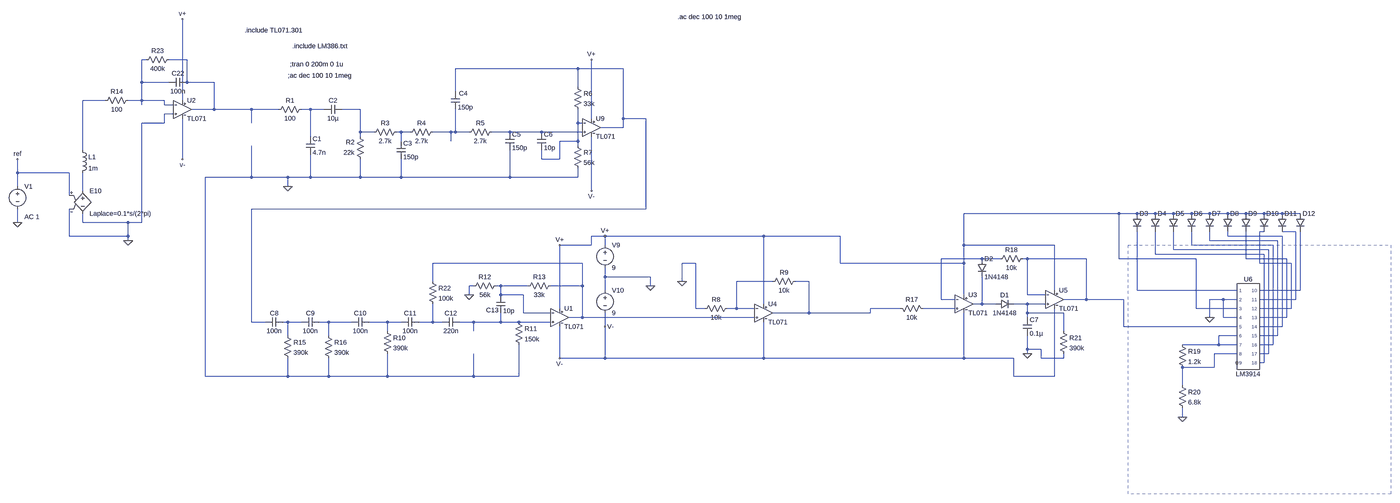
[diagram p0: schematic Analog - Final.asc, whole sheet]
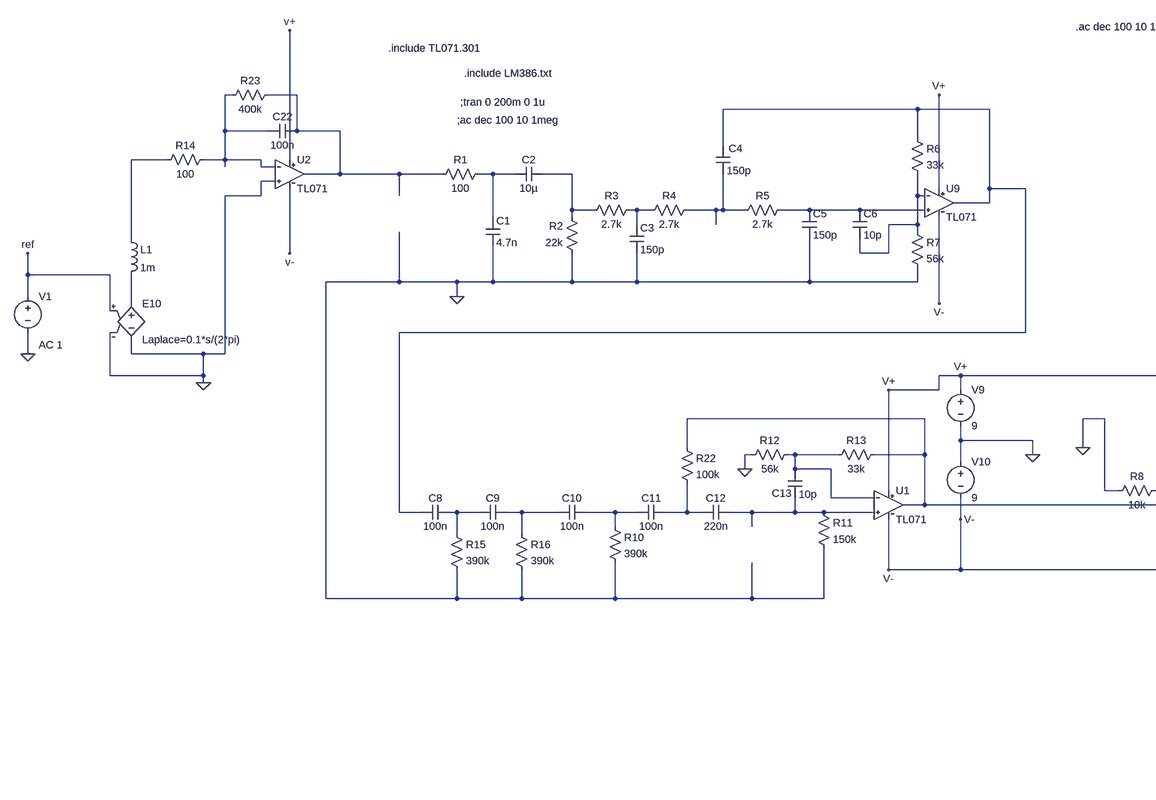
[diagram p1: schematic Analog - Final.asc, part, row 1 of 1, column 1 of 2]
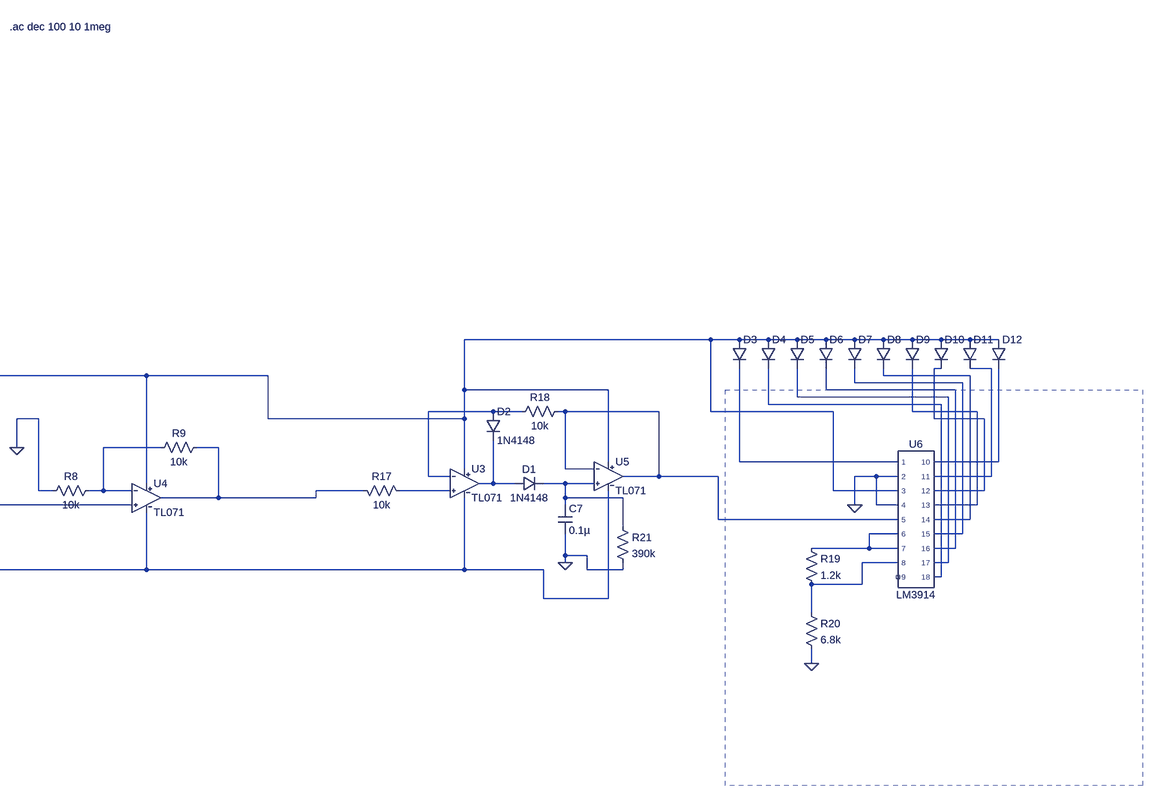
[diagram p2: schematic Analog - Final.asc, part, row 1 of 1, column 2 of 2]
Analog - Final.asc, the LTspice schematic file:
Version 4
SHEET 1 4752 1492
WIRE -560 -48 -576 -48
WIRE -416 -48 -480 -48
WIRE 992 -16 560 -16
WIRE 1152 -16 992 -16
WIRE -576 32 -576 -48
WIRE -480 32 -576 32
WIRE -416 32 -416 -48
WIRE -320 32 -416 32
WIRE 992 48 992 -16
WIRE 560 64 560 -16
WIRE -704 96 -784 96
WIRE -576 96 -576 32
WIRE -576 96 -624 96
WIRE -496 96 -576 96
WIRE -432 96 -432 -192
WIRE -576 112 -576 96
WIRE -496 112 -496 96
WIRE -464 112 -496 112
WIRE -320 128 -320 32
WIRE -320 128 -400 128
WIRE -160 128 -320 128
WIRE -64 128 -160 128
WIRE 48 128 16 128
WIRE 96 128 48 128
WIRE 224 128 160 128
WIRE -464 144 -496 144
WIRE 1040 160 1040 -48
WIRE 1152 160 1152 -16
WIRE 1232 160 1152 160
WIRE -496 176 -496 144
WIRE -496 176 -576 176
WIRE -160 176 -160 128
WIRE 992 176 992 128
WIRE 1008 176 992 176
WIRE 1152 192 1152 160
WIRE 1152 192 1072 192
WIRE 224 208 224 128
WIRE 272 208 224 208
WIRE 368 208 352 208
WIRE 400 208 368 208
WIRE 544 208 480 208
WIRE 560 208 560 128
WIRE 560 208 544 208
WIRE 608 208 560 208
WIRE 752 208 688 208
WIRE 864 208 752 208
WIRE 1008 208 864 208
WIRE 48 224 48 128
WIRE 224 224 224 208
WIRE 368 240 368 208
WIRE 544 240 544 208
WIRE 992 240 992 176
WIRE 992 240 928 240
WIRE 992 256 992 240
WIRE -784 272 -784 96
WIRE -432 304 -432 160
WIRE 864 304 864 272
WIRE 928 304 928 240
WIRE 928 304 864 304
WIRE -1056 352 -1056 304
WIRE -832 352 -1056 352
WIRE -160 368 -160 256
WIRE -160 368 -352 368
WIRE -32 368 -160 368
WIRE 48 368 48 288
WIRE 48 368 -32 368
WIRE 224 368 224 304
WIRE 224 368 48 368
WIRE 368 368 368 304
WIRE 368 368 224 368
WIRE 752 368 752 272
WIRE 752 368 368 368
WIRE 992 368 992 336
WIRE 992 368 752 368
WIRE -1056 400 -1056 352
WIRE -32 400 -32 368
WIRE -784 416 -784 352
WIRE 1040 416 1040 224
WIRE -832 432 -832 352
WIRE 1232 480 1232 160
WIRE 1232 480 -160 480
WIRE 3216 496 2640 496
WIRE 3280 496 3216 496
WIRE 3344 496 3280 496
WIRE 3408 496 3344 496
WIRE 3472 496 3408 496
WIRE 3536 496 3472 496
WIRE 3600 496 3536 496
WIRE 3664 496 3600 496
WIRE 3728 496 3664 496
WIRE 3792 496 3728 496
WIRE 3856 496 3792 496
WIRE -1056 528 -1056 480
WIRE -784 528 -784 496
WIRE -624 528 -784 528
WIRE -576 528 -576 176
WIRE -576 528 -624 528
WIRE 3728 560 3712 560
WIRE 3840 560 3792 560
WIRE -832 576 -832 480
WIRE -624 576 -624 528
WIRE -624 576 -832 576
WIRE 1088 576 1040 576
WIRE 1648 576 1088 576
WIRE 1968 576 1648 576
WIRE 3600 576 3600 560
WIRE 3792 576 3600 576
WIRE -624 592 -624 576
WIRE 3536 592 3536 560
WIRE 3776 592 3536 592
WIRE 1040 608 1040 576
WIRE 1040 608 928 608
WIRE 1088 608 1088 576
WIRE 2640 608 2640 496
WIRE 2960 608 2640 608
WIRE 3472 608 3472 560
WIRE 3760 608 3472 608
WIRE 3408 624 3408 560
WIRE 3744 624 3408 624
WIRE 3344 640 3344 560
WIRE 3728 640 3344 640
WIRE 2704 656 2560 656
WIRE 2768 656 2704 656
WIRE 2864 656 2848 656
WIRE 3072 656 2864 656
WIRE 3216 656 3216 496
WIRE 3488 656 3216 656
WIRE 3664 656 3664 560
WIRE 3808 656 3664 656
WIRE 1008 672 480 672
WIRE 1408 672 1360 672
WIRE 1968 672 1968 576
WIRE 2640 672 2640 608
WIRE 2640 672 1968 672
WIRE 3712 672 3712 560
WIRE 3824 672 3712 672
WIRE 1088 720 1088 688
WIRE 1248 720 1088 720
WIRE 480 736 480 672
WIRE 1360 736 1360 672
WIRE 1680 736 1552 736
WIRE 1808 736 1760 736
WIRE 624 752 608 752
WIRE 720 752 704 752
WIRE 816 752 720 752
WIRE 1008 752 1008 672
WIRE 1008 752 896 752
WIRE 1248 752 1248 720
WIRE 1088 768 1088 720
WIRE 2960 768 2960 608
WIRE 3280 768 3280 560
WIRE 3632 768 3280 768
WIRE 3856 768 3856 560
WIRE 3856 768 3712 768
WIRE 608 784 608 752
WIRE 720 784 720 752
WIRE 800 784 720 784
WIRE 2640 784 2640 672
WIRE 2864 784 2864 656
WIRE 2928 784 2864 784
WIRE 2560 800 2560 656
WIRE 2608 800 2560 800
WIRE 3072 800 3072 656
WIRE 3072 800 2992 800
WIRE 3232 800 3072 800
WIRE 3584 800 3536 800
WIRE 3632 800 3584 800
WIRE 3840 800 3840 560
WIRE 3840 800 3712 800
WIRE 1648 816 1648 576
WIRE 2704 816 2704 720
WIRE 2704 816 2672 816
WIRE 2752 816 2704 816
WIRE 2864 816 2816 816
WIRE 2928 816 2864 816
WIRE 928 832 928 608
WIRE 1408 832 1408 672
WIRE 1440 832 1408 832
WIRE 1552 832 1552 736
WIRE 1552 832 1520 832
WIRE 1616 832 1552 832
WIRE 2416 832 2288 832
WIRE 2608 832 2496 832
WIRE 3488 832 3488 656
WIRE 3632 832 3488 832
WIRE 3824 832 3824 672
WIRE 3824 832 3712 832
WIRE 800 848 800 784
WIRE 896 848 800 848
WIRE 1808 848 1808 736
WIRE 1808 848 1680 848
WIRE 2288 848 2288 832
WIRE 2288 848 1808 848
WIRE 2864 848 2864 816
WIRE 2992 848 2864 848
WIRE 1008 864 1008 752
WIRE 1008 864 960 864
WIRE 1616 864 1008 864
WIRE 2864 864 2864 848
WIRE 3536 864 3536 800
WIRE 3584 864 3584 800
WIRE 3632 864 3584 864
WIRE 3808 864 3808 656
WIRE 3808 864 3712 864
WIRE -160 880 -160 480
WIRE -112 880 -160 880
WIRE -32 880 -48 880
WIRE 16 880 -32 880
WIRE 112 880 80 880
WIRE 192 880 112 880
WIRE 320 880 256 880
WIRE 368 880 320 880
WIRE 480 880 480 816
WIRE 480 880 432 880
WIRE 512 880 480 880
WIRE 624 880 576 880
WIRE 720 880 720 848
WIRE 720 880 624 880
WIRE 784 880 720 880
WIRE 896 880 784 880
WIRE 1088 896 1088 848
WIRE 3232 896 3232 800
WIRE 3632 896 3232 896
WIRE 3792 896 3792 576
WIRE 3792 896 3712 896
WIRE 320 912 320 880
WIRE 624 912 624 880
WIRE 2992 912 2992 848
WIRE -32 928 -32 880
WIRE 112 928 112 880
WIRE 3632 928 3568 928
WIRE 3776 928 3776 592
WIRE 3776 928 3712 928
WIRE 3568 960 3568 928
WIRE 3568 960 3440 960
WIRE 3632 960 3568 960
WIRE 3760 960 3760 608
WIRE 3760 960 3712 960
WIRE 2864 976 2864 928
WIRE 2912 976 2864 976
WIRE 2864 992 2864 976
WIRE 3632 992 3552 992
WIRE 3744 992 3744 624
WIRE 3744 992 3712 992
WIRE 928 1008 928 896
WIRE 1088 1008 1088 896
WIRE 1088 1008 928 1008
WIRE 1648 1008 1648 880
WIRE 1648 1008 1088 1008
WIRE 2640 1008 2640 848
WIRE 2640 1008 1648 1008
WIRE 2816 1008 2640 1008
WIRE 2912 1008 2912 976
WIRE 2992 1008 2992 992
WIRE 2992 1008 2912 1008
WIRE 3728 1024 3728 640
WIRE 3728 1024 3712 1024
WIRE 3552 1040 3552 992
WIRE 3552 1040 3440 1040
WIRE -352 1072 -352 368
WIRE -32 1072 -32 1008
WIRE -32 1072 -352 1072
WIRE 112 1072 112 1008
WIRE 112 1072 -32 1072
WIRE 320 1072 320 992
WIRE 320 1072 112 1072
WIRE 624 1072 624 992
WIRE 624 1072 320 1072
WIRE 784 1072 784 960
WIRE 784 1072 624 1072
WIRE 2816 1072 2816 1008
WIRE 2960 1072 2960 832
WIRE 2960 1072 2816 1072
WIRE 3440 1104 3440 1040
WIRE 3440 1216 3440 1184
FLAG -32 400 0
FLAG 608 784 0
FLAG 1040 -48 V+
FLAG 928 608 V+
FLAG 1040 416 V-
FLAG 928 1008 V-
FLAG -624 592 0
FLAG -432 -192 v+
FLAG -432 304 v-
FLAG 1248 752 0
FLAG 1088 576 V+
FLAG 1088 896 V-
FLAG 1360 736 0
FLAG 2864 992 0
FLAG 3536 864 0
FLAG 3440 1216 0
FLAG -1056 528 0
FLAG -1056 304 ref
SYMBOL res 32 112 R90
WINDOW 0 0 56 VBottom 2
WINDOW 3 32 56 VTop 2
SYMATTR InstName R1
SYMATTR Value 100
SYMBOL res 240 320 R180
WINDOW 0 36 76 Left 2
WINDOW 3 36 40 Left 2
SYMATTR InstName R2
SYMATTR Value 22k
SYMBOL res 256 224 R270
WINDOW 0 32 56 VTop 2
WINDOW 3 0 56 VBottom 2
SYMATTR InstName R3
SYMATTR Value 2.7k
SYMBOL cap 32 224 R0
SYMATTR InstName C1
SYMATTR Value 4.7n
SYMBOL cap 160 112 R90
WINDOW 0 0 32 VBottom 2
WINDOW 3 32 32 VTop 2
SYMATTR InstName C2
SYMATTR Value 10µ
SYMBOL cap 544 64 R0
WINDOW 0 28 7 Left 2
SYMATTR InstName C4
SYMATTR Value 150p
SYMBOL res 704 192 R90
WINDOW 0 0 56 VBottom 2
WINDOW 3 32 56 VTop 2
SYMATTR InstName R5
SYMATTR Value 2.7k
SYMBOL res 976 32 R0
SYMATTR InstName R6
SYMATTR Value 33k
SYMBOL cap 736 208 R0
SYMATTR InstName C5
SYMATTR Value 150p
SYMBOL cap 848 208 R0
SYMATTR InstName C6
SYMATTR Value 10p
SYMBOL res 976 240 R0
SYMATTR InstName R7
SYMATTR Value 56k
SYMBOL res 304 896 R0
SYMATTR InstName R10
SYMATTR Value 390k
SYMBOL cap 256 864 R90
WINDOW 0 0 32 VBottom 2
WINDOW 3 32 32 VTop 2
SYMATTR InstName C10
SYMATTR Value 100n
SYMBOL cap 432 864 R90
WINDOW 0 0 32 VBottom 2
WINDOW 3 32 32 VTop 2
SYMATTR InstName C11
SYMATTR Value 100n
SYMBOL cap 576 864 R90
WINDOW 0 0 32 VBottom 2
WINDOW 3 32 32 VTop 2
SYMATTR InstName C12
SYMATTR Value 220n
SYMBOL res 464 720 R0
SYMATTR InstName R22
SYMATTR Value 100k
SYMBOL res 768 864 R0
SYMATTR InstName R11
SYMATTR Value 150k
SYMBOL cap 704 784 R0
WINDOW 0 -36 54 Left 2
SYMATTR InstName C13
SYMATTR Value 10p
SYMBOL res 720 736 R90
WINDOW 0 0 56 VBottom 2
WINDOW 3 32 56 VTop 2
SYMATTR InstName R12
SYMATTR Value 56k
SYMBOL res 912 736 R90
WINDOW 0 0 56 VBottom 2
WINDOW 3 32 56 VTop 2
SYMATTR InstName R13
SYMATTR Value 33k
SYMBOL ind -800 256 R0
SYMATTR InstName L1
SYMATTR Value 1m
SYMATTR SpiceLine Rser=1m
SYMBOL res -608 80 R90
WINDOW 0 0 56 VBottom 2
WINDOW 3 32 56 VTop 2
SYMATTR InstName R14
SYMATTR Value 100
SYMBOL res -464 -64 R90
WINDOW 0 0 56 VBottom 2
WINDOW 3 32 56 VTop 2
SYMATTR InstName R23
SYMATTR Value 400k
SYMBOL cap -416 16 R90
WINDOW 0 0 32 VBottom 2
WINDOW 3 32 32 VTop 2
SYMATTR InstName C22
SYMATTR Value 100n
SYMBOL TL071 1040 128 R0
SYMATTR InstName U9
SYMATTR SpiceModel ""
SYMBOL TL071 928 800 R0
SYMATTR InstName U1
SYMATTR SpiceModel ""
SYMBOL TL071 -432 64 R0
SYMATTR InstName U2
SYMATTR SpiceModel ""
SYMBOL voltage 1088 592 R0
WINDOW 123 0 0 Left 0
WINDOW 39 0 0 Left 0
SYMATTR InstName V9
SYMATTR Value 9
SYMBOL voltage 1088 752 R0
WINDOW 123 0 0 Left 0
WINDOW 39 0 0 Left 0
SYMATTR InstName V10
SYMATTR Value 9
SYMBOL diode 2752 832 R270
WINDOW 0 32 32 VTop 2
WINDOW 3 0 32 VBottom 2
SYMATTR InstName D1
SYMATTR Value 1N4148
SYMBOL cap 2848 864 R0
SYMATTR InstName C7
SYMATTR Value 0.1µ
SYMBOL TL071 2640 752 R0
SYMATTR InstName U3
SYMATTR SpiceModel ""
SYMBOL TL071 1648 784 R0
SYMATTR InstName U4
SYMATTR SpiceModel ""
SYMBOL res 1536 816 R90
WINDOW 0 0 56 VBottom 2
WINDOW 3 32 56 VTop 2
SYMATTR InstName R8
SYMATTR Value 10k
SYMBOL res 1776 720 R90
WINDOW 0 0 56 VBottom 2
WINDOW 3 32 56 VTop 2
SYMATTR InstName R9
SYMATTR Value 10k
SYMBOL cap 80 864 R90
WINDOW 0 0 32 VBottom 2
WINDOW 3 32 32 VTop 2
SYMATTR InstName C9
SYMATTR Value 100n
SYMBOL res 96 912 R0
SYMATTR InstName R16
SYMATTR Value 390k
SYMBOL cap -48 864 R90
WINDOW 0 0 32 VBottom 2
WINDOW 3 32 32 VTop 2
SYMATTR InstName C8
SYMATTR Value 100n
SYMBOL res -48 912 R0
SYMATTR InstName R15
SYMATTR Value 390k
SYMBOL res 496 192 R90
WINDOW 0 0 56 VBottom 2
WINDOW 3 32 56 VTop 2
SYMATTR InstName R4
SYMATTR Value 2.7k
SYMBOL cap 352 240 R0
SYMATTR InstName C3
SYMATTR Value 150p
SYMBOL TL071 2960 736 R0
SYMATTR InstName U5
SYMATTR SpiceModel ""
SYMBOL res 2400 816 M90
WINDOW 0 0 56 VBottom 2
WINDOW 3 32 56 VTop 2
SYMATTR InstName R17
SYMATTR Value 10k
SYMBOL diode 2688 656 R0
SYMATTR InstName D2
SYMATTR Value 1N4148
SYMBOL res 2864 640 R90
WINDOW 0 0 56 VBottom 2
WINDOW 3 32 56 VTop 2
SYMATTR InstName R18
SYMATTR Value 10k
SYMBOL LM3914 3664 896 R0
SYMATTR InstName U6
SYMBOL res 3424 944 R0
SYMATTR InstName R19
SYMATTR Value 1.2k
SYMBOL res 3424 1088 R0
SYMATTR InstName R20
SYMATTR Value 6.8k
SYMBOL diode 3264 496 R0
WINDOW 3 49 54 Invisible 0
SYMATTR Value QTLP690C
SYMATTR InstName D3
SYMBOL diode 3328 496 R0
WINDOW 3 24 28 Invisible 2
SYMATTR Value QTLP690C
SYMATTR InstName D4
SYMBOL diode 3392 496 R0
WINDOW 3 24 28 Invisible 2
SYMATTR Value QTLP690C
SYMATTR InstName D5
SYMBOL diode 3456 496 R0
WINDOW 3 24 28 Invisible 2
SYMATTR Value QTLP690C
SYMATTR InstName D6
SYMBOL diode 3520 496 R0
WINDOW 3 24 28 Invisible 2
SYMATTR Value QTLP690C
SYMATTR InstName D7
SYMBOL diode 3584 496 R0
WINDOW 3 24 28 Invisible 2
SYMATTR Value QTLP690C
SYMATTR InstName D8
SYMBOL diode 3648 496 R0
WINDOW 3 24 28 Invisible 2
SYMATTR Value QTLP690C
SYMATTR InstName D9
SYMBOL diode 3712 496 R0
WINDOW 3 24 28 Invisible 2
SYMATTR Value QTLP690C
SYMATTR InstName D10
SYMBOL diode 3776 496 R0
WINDOW 3 24 28 Invisible 2
SYMATTR Value QTLP690C
SYMATTR InstName D11
SYMBOL diode 3840 496 R0
WINDOW 3 24 28 Invisible 2
SYMATTR Value QTLP690C
SYMATTR InstName D12
SYMBOL res 2976 896 R0
SYMATTR InstName R21
SYMATTR Value 390k
SYMBOL e -784 400 R0
SYMATTR InstName E10
SYMATTR Value Laplace=0.1*s/(2*pi)
SYMBOL voltage -1056 384 R0
WINDOW 123 24 124 Left 2
WINDOW 39 0 0 Left 0
SYMATTR InstName V1
SYMATTR Value ""
SYMATTR Value2 AC 1
TEXT -16 -96 Left 2 !.include LM386.txt
TEXT -184 -152 Left 2 !.include TL071.301
TEXT -24 -32 Left 2 !;tran 0 200m 0 1u
TEXT -32 8 Left 2 !;ac dec 100 10 1meg
TEXT 1344 -200 Left 2 !.ac dec 100 10 1meg
RECTANGLE Normal 4176 1488 3248 608 2

The netlist it stands for:
* Analog - Final.asc
R1 N005 N002 100
R2 0 N006 22k
R3 N006 N008 2.7k
C1 N005 0 4.7n
C2 N006 N005 10µ
C4 N003 N009 150p
R5 N010 N009 2.7k
R6 N003 N007 33k
C5 N010 0 150p
C6 N010 N007 10p
R7 N007 0 56k
R10 N033 0 390k
C10 N033 N032 100n
C11 N034 N033 100n
C12 N035 N034 220n
R22 N022 N034 100k
R11 N035 0 150k
C13 N025 N035 10p
R12 N025 0 56k
R13 N022 N025 33k
L1 N004 N011 1m Rser=1m
R14 N001 N004 100
R23 N002 N001 400k
C22 N002 N001 100n
XU9 N010 N007 V+ V- N003 TL071  ; pins In+ In- V+ V- OUT
XU1 N035 N025 V+ V- N022 TL071  ; pins In+ In- V+ V- OUT
XU2 0 N001 V+ V- N002 TL071  ; pins In+ In- V+ V- OUT
V9 V+ 0 9
V10 0 V- 9
D1 N028 N029 1N4148
C7 N029 0 0.1µ
XU3 N030 N019 V+ V- N028 TL071  ; pins In+ In- V+ V- OUT
XU4 N022 N023 V+ V- N024 TL071  ; pins In+ In- V+ V- OUT
R8 N023 0 10k
R9 N024 N023 10k
C9 N032 N031 100n
R16 N032 0 390k
C8 N031 N003 100n
R15 N031 0 390k
R4 N009 N008 2.7k
C3 N008 0 150p
XU5 N029 N020 V+ V- N020 TL071  ; pins In+ In- V+ V- OUT
R17 N024 N030 10k
D2 N019 N028 1N4148
R18 N020 N019 10k
XU6 N026 0 V+ 0 N020 N036 N036 N037 NC_01 N027 N013 N012 N021 N014 N015 N016 N017 N018 LM3914  ; pins 1 2 3 4 5 6 7 8 9 10 11 12 13 14 15 16 17 18
R19 N036 N037 1.2k
R20 N037 0 6.8k
D3 V+ N026 QTLP690C
D4 V+ N018 QTLP690C
D5 V+ N017 QTLP690C
D6 V+ N016 QTLP690C
D7 V+ N015 QTLP690C
D8 V+ N014 QTLP690C
D9 V+ N021 QTLP690C
D10 V+ N012 QTLP690C
D11 V+ N013 QTLP690C
D12 V+ N027 QTLP690C
R21 N029 0 390k
E10 N011 0 ref 0 Laplace=0.1*s/(2*pi)
V1 ref 0 AC 1
.model D D
.lib standard.dio
.include LM386.txt
.include TL071.301
;tran 0 200m 0 1u
;ac dec 100 10 1meg
.ac dec 100 10 1meg
.lib TL071.301
.lib LM3914.lib
.backanno
.end